# Altium schematic sheet Top-Sheet.SchDoc
size A4; SheetNumber: 1; SheetTotal: 4
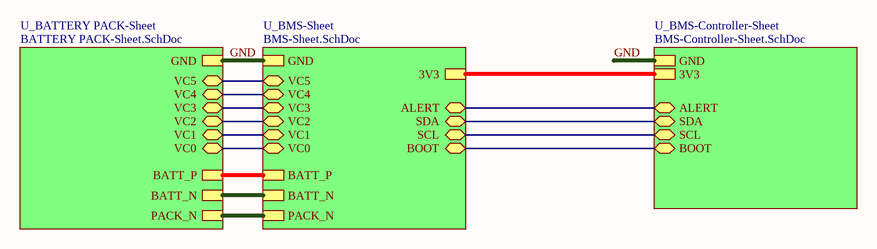
[diagram p0: Top-Sheet.SchDoc]

## Sub-sheets
U_BATTERY PACK-Sheet = BATTERY PACK-Sheet.SchDoc: BATT_P, VC0 (bidir), BATT_N, VC1 (bidir), VC2 (bidir), VC3 (bidir), VC4 (bidir), VC5 (bidir), PACK_N, GND
U_BMS-Controller-Sheet = BMS-Controller-Sheet.SchDoc: GND, 3V3, ALERT (bidir), SDA (bidir), SCL (bidir), BOOT (bidir)
U_BMS-Sheet = BMS-Sheet.SchDoc: 3V3, ALERT (bidir), BOOT (bidir), SDA (bidir), SCL (bidir), VC0 (bidir), VC1 (bidir), VC2 (bidir), VC3 (bidir), VC4 (bidir), VC5 (bidir), BATT_P, BATT_N, PACK_N, GND

## Nets
GND: sheet U_BMS-Sheet/GND, sheet U_BMS-Controller-Sheet/GND, sheet U_BATTERY PACK-Sheet/GND
(unnamed): sheet U_BMS-Sheet/3V3, sheet U_BMS-Controller-Sheet/3V3
(unnamed): sheet U_BMS-Sheet/ALERT, sheet U_BMS-Controller-Sheet/ALERT
(unnamed): sheet U_BMS-Sheet/BOOT, sheet U_BMS-Controller-Sheet/BOOT
(unnamed): sheet U_BMS-Sheet/SDA, sheet U_BMS-Controller-Sheet/SDA
(unnamed): sheet U_BMS-Sheet/SCL, sheet U_BMS-Controller-Sheet/SCL
(unnamed): sheet U_BMS-Sheet/VC0, sheet U_BATTERY PACK-Sheet/VC0
(unnamed): sheet U_BMS-Sheet/VC1, sheet U_BATTERY PACK-Sheet/VC1
(unnamed): sheet U_BMS-Sheet/VC2, sheet U_BATTERY PACK-Sheet/VC2
(unnamed): sheet U_BMS-Sheet/VC3, sheet U_BATTERY PACK-Sheet/VC3
(unnamed): sheet U_BMS-Sheet/VC4, sheet U_BATTERY PACK-Sheet/VC4
(unnamed): sheet U_BMS-Sheet/VC5, sheet U_BATTERY PACK-Sheet/VC5
(unnamed): sheet U_BMS-Sheet/BATT_P, sheet U_BATTERY PACK-Sheet/BATT_P
(unnamed): sheet U_BMS-Sheet/BATT_N, sheet U_BATTERY PACK-Sheet/BATT_N
(unnamed): sheet U_BMS-Sheet/PACK_N, sheet U_BATTERY PACK-Sheet/PACK_N

## Notes on the sheet
- File:
- Title:
- Date:
- Page
- Num:
- Total:
- Drawn By: Huzaifa Ali